# Altium schematic sheet Sheet2.SchDoc
size A4; SheetNumber: 2; SheetTotal: 2
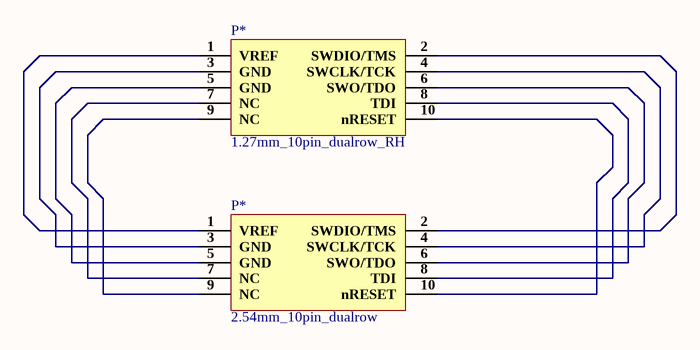
[diagram p0: Sheet2.SchDoc]

## Parts
(Parts that share a designator on the sheet are numbered #1, #2 ... from top to bottom, then left to right.)
P*#1  1.27mm_10pin_dualrow_RH  [1.27mm_10pin_dualrow_RH]
P*#2  2.54mm_10pin_dualrow  [2.54mm_10pin_dualrow]

## Nets
NetP*#1_1: P*#1.1(VREF) P*#2.1(VREF)
NetP*#1_2: P*#1.2(SWDIO/TMS) P*#2.2(SWDIO/TMS)
NetP*#1_3: P*#1.3(GND) P*#2.3(GND)
NetP*#1_4: P*#1.4(SWCLK/TCK) P*#2.4(SWCLK/TCK)
NetP*#1_5: P*#1.5(GND) P*#2.5(GND)
NetP*#1_6: P*#1.6(SWO/TDO) P*#2.6(SWO/TDO)
NetP*#1_7: P*#1.7(NC) P*#2.7(NC)
NetP*#1_8: P*#1.8(TDI) P*#2.8(TDI)
NetP*#1_9: P*#1.9(NC) P*#2.9(NC)
NetP*#1_10: P*#1.10(nRESET) P*#2.10(nRESET)

## Library data of the parts
P*#1 = 1.27mm_10pin_dualrow_RH: JTAG/SWD